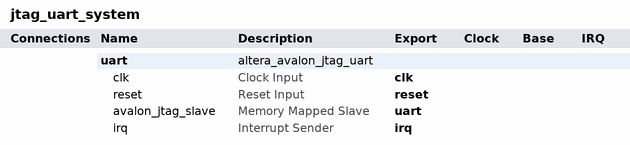
[diagram p0: system contents]
# Platform Designer (Qsys) system jtag_uart_system, Cyclone IV E EP4CE115F29C7
# Parameters at their usual value, and those the tool derives, are not listed.
package require -exact qsys 25.1
create_system jtag_uart_system
set_project_property DEVICE_FAMILY {Cyclone IV E}
set_project_property DEVICE EP4CE115F29C7

add_instance uart altera_avalon_jtag_uart 25.1
set_instance_parameter_value uart simInteractiveOptions NO_INTERACTIVE_WINDOWS

# exported interfaces
add_interface clk clock sink
set_interface_property clk EXPORT_OF uart.clk
add_interface irq interrupt sender
set_interface_property irq EXPORT_OF uart.irq
add_interface reset reset sink
set_interface_property reset EXPORT_OF uart.reset
add_interface uart avalon slave
set_interface_property uart EXPORT_OF uart.avalon_jtag_slave

set_interconnect_requirement {$system} qsys_mm.clockCrossingAdapter HANDSHAKE
set_interconnect_requirement {$system} qsys_mm.enableEccProtection FALSE
set_interconnect_requirement {$system} qsys_mm.insertDefaultSlave FALSE
set_interconnect_requirement {$system} qsys_mm.maxAdditionalLatency 1

save_system jtag_uart_system.qsys
